# Altium schematic sheet S4_Baro_Mag.SchDoc
size 420 x 297 mm; SheetNumber: 4; SheetTotal: 11
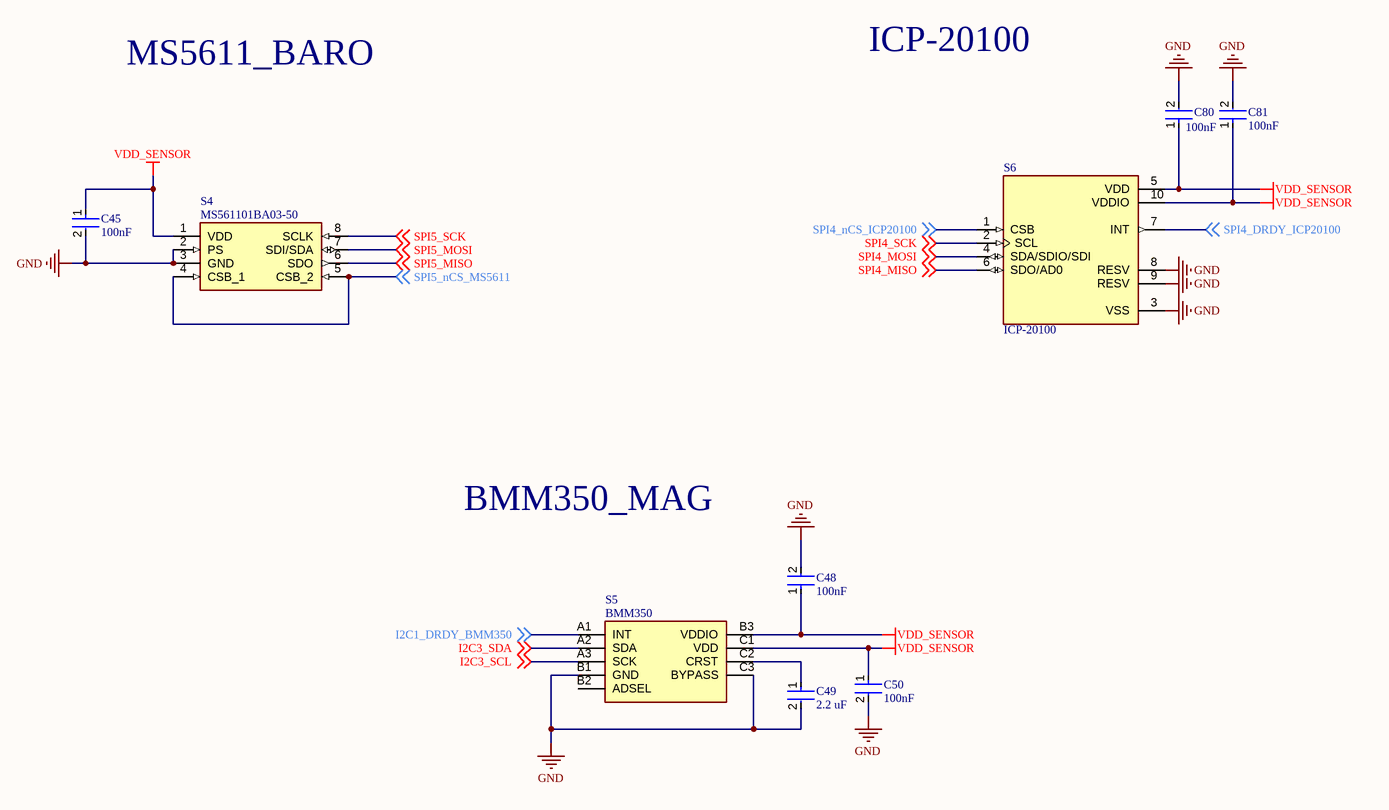
[diagram p0: S4_Baro_Mag.SchDoc]

## Parts
C45  100nF  [FP-CC0402-MFG]
C48  100nF  [FP-CC0402-MFG]
C49  2.2 uF  [FP-C1005-050-IPC_A]
C50  100nF  [FP-CC0402-MFG]
C80  100nF  [FP-CC0402-MFG]
C81  100nF  [FP-CC0402-MFG]
S4  MS561101BA03-50  [MS561101BA03-50]
S5  BMM350  [BGA9C40P3X3_128X128X54]
S6  ICP-20100  [PQFN50P200X200X85-10N]

## Nets
GND: C45.2 C48.2 C49.2 C50.2 C80.2 C81.2 S4.2(PS) S4.3(GND) S5.B1(GND) S5.C3(BYPASS) S6.3(VSS) S6.8(RESV) S6.9(RESV)
VDD_SENSOR: C45.1 C48.1 C50.1 C80.1 C81.1 S4.1(VDD) S5.B3(VDDIO) S5.C1(VDD) S6.5(VDD) S6.10(VDDIO)
I2C1_DRDY_BMM350: S5.A1(INT) ; off-sheet I2C1_DRDY_BMM350
I2C3_SCL: S5.A3(SCK) ; off-sheet I2C3_SCL
I2C3_SDA: S5.A2(SDA) ; off-sheet I2C3_SDA
SPI4_DRDY_ICP20100: S6.7(INT) ; off-sheet SPI4_DRDY_ICP20100
SPI4_MISO: S6.6(SDO/AD0) ; off-sheet SPI4_MISO
SPI4_MOSI: S6.4(SDA/SDIO/SDI) ; off-sheet SPI4_MOSI
SPI4_nCS_ICP20100: S6.1(CSB) ; off-sheet SPI4_nCS_ICP20100
SPI4_SCK: S6.2(SCL) ; off-sheet SPI4_SCK
SPI5_MISO: S4.6(SDO) ; off-sheet SPI5_MISO
SPI5_MOSI: S4.7(SDI/SDA) ; off-sheet SPI5_MOSI
SPI5_nCS_MS5611: S4.4(CSB_1) S4.5(CSB_2) ; off-sheet SPI5_nCS_MS5611
SPI5_SCK: S4.8(SCLK) ; off-sheet SPI5_SCK
NetC49_1: C49.1 S5.C2(CRST)

Not connected (* = marked no-connect by the designer): S5 B2(ADSEL)

## Notes on the sheet
- MS5611_BARO
- ICP-20100
- BMM350_MAG
- THIS DOCUMENT AND THE DATA DISCLOSED HEREIN OR
- HEREWITH IS THE PROPERTY OF ALTIUM LIMITED AND MAY
- DWG NO:
- REVISION
- REV:
- DESCRIPTION
- DATE
- APPROVED
- BE FREELY DISTRIBUTED IN WHOLE. NO RIGHTS ARE
- RESERVED OR EXPRESS OR IMPLIED WARANTEE GIVEN.
- ENG:
- APPROVALS
- PROJECT
- DSN:
- CHK:
- REFERENCE DOCUMENTS
- PROJECT REVISION:
- TITLE
- DOCUMENT REVISION:
- DESIGN ITEM:
- BOM:
- FAB DWG:
- PCB DWG:
- ASSY DWG:
- SCALE:
- A3
- SIZE
- CAGE CODE
- FILE NAME
- DWG NO.
- SHEET
- OF
- REV

## Library data of the parts
C45 C48 C50 C80 C81 = CMP-03422-001121-1: CAP CER 0.1UF 16V X7R 0402; Manufacturer: YAGEO; Manufacturer Part Number: CC0402KPX7R7BB104; Material: Ceramic; Temperature Coefficient: 30ppm/°C; Automotive Grade: NA; Tolerance: 0.1; Digikey Description: CAP CER 0.1UF 16V X7R 0402; Temperature Range Low: -55°C; Footprint Url: http://www.yageo.com/exep/pages/download/literatures/UPY-C_GEN_24.pdf; RoHS: TRUE; Device Class L3: Ceramic Capacitors; Temperature Characteristic: X7R; Capacitance: 100 nF; Package: CC0402; Device Class L1: Passive Components; Lead Free: Yes; Temperature Range High: +125°C; Category: Cap; Mouser Description: 0402 0.1 uF 16 V ±10% Tolerance X7R SMT Multilayer Ceramic Capacitor; Voltage Rating: 16 V; Value: 100 nF; ComponentLink2Description: Datasheet; Automotive: No; Octopart: https://octopart.com/cc0402kpx7r7bb104-yageo-21548559; ComponentLink2URL: http://www.yageo.com/documents/recent/UPY-GP_NP0_16V-to-50V_16.pdf; Height: 0.55mm; Device Class L2: Capacitors; Temperature: -55°C to +125°C; Ipc Land Pattern Name: CAPC10050X50
C49 = CMP-08246-004339-1: CAP CER 2.2UF 25V X5R 0402; Dielectric Material: Ceramic; Tolerance: 10%; REACH SVHC: No SVHC; Weight: 2.3E-05oz; Capacitance: 2.2uF; Length: 1mm; RoHS Compliant: Yes; Package Quantity: 1; Voltage Rating (DC): 25V; Dielectric: X5R; Series: C; Voltage Rating: 25V; Case Code (Imperial): 0402; Min Operating Temperature: -55°C; Depth: 0.5mm; Resistor Type: Ceramic; Height: 0.5mm; Width: 0.5mm; Mount: Surface Mount; Case Code (Metric): 1005; Case/Package: 0402; Max Operating Temperature: 85°C; Thickness: 0.022inch; Lead Free: Lead Free; Termination: SMD/SMT; Packaging: Tape and Reel
S4 = MS561101BA03-50: Integrated Circuit; Manufacturer_Name: TE Connectivity; Datasheet Link: https://www.te.com/commerce/DocumentDelivery/DDEController?Action=srchrtrv&DocNm=MS5611-01BA03&DocType=Data%20Sheet&DocLang=English&PartCntxt=MS561101BA03-50&DocFormat=pdf; Manufacturer_Part_Number: MS561101BA03-50; Mouser Part Number: 824-MS561101BA03-50; Mouser Price/Stock: https://www.mouser.co.uk/ProductDetail/Measurement-Specialties/MS561101BA03-50?qs=%252BgKeJhng5iV%252BnCz6Qd5iDw%3D%3D; Arrow Part Number: MS561101BA03-50; Arrow Price/Stock: https://www.arrow.com/en/products/ms561101ba03-50/te-connectivity?region=nac
S5 = BMM350: Integrated Circuit; Manufacturer_Name: BOSCH; Datasheet Link: https://www.bosch-sensortec.com/media/boschsensortec/downloads/datasheets/bst-bmm350-ds001.pdf; Height: 0.54mm; Manufacturer_Part_Number: BMM350; Mouser Part Number: 262-BMM350; Mouser Price/Stock: https://www.mouser.co.uk/ProductDetail/Bosch-Sensortec/BMM350?qs=amGC7iS6iy9v98dnmxozLQ%3D%3D; Arrow Part Number: BMM350; Arrow Price/Stock: https://www.arrow.com/en/products/bmm350/bosch?region=nac
S6 = CMP-010-00027-1: MF: TDK InvenSense; Availability: Not in stock; SnapEDA_Link: https://www.snapeda.com/parts/ICP-20100/TDK%20InvenSense/view-part/7331147/?ref=snap; Check_prices: https://www.snapeda.com/parts/ICP-20100/TDK%20InvenSense/view-part/7331147/?ref=eda; Source: ICP-20100.SchLib; Pins: 10; Value: *; Component Type: Standard; Case/Package: None; Design Item ID: ICP-20100; Price: None; MP: ICP-20100